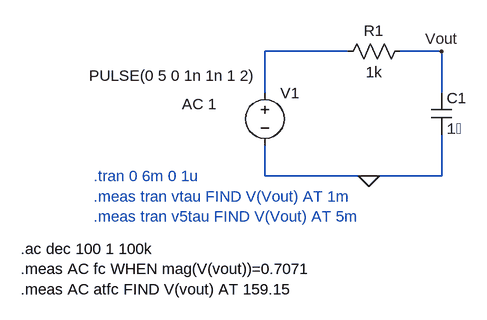
[diagram p0: schematic rc_lowpass.asc]
rc_lowpass.asc, the LTspice schematic file:
Version 4.1
SHEET 1 880 680
WIRE 128 0 0 0
WIRE 272 0 208 0
WIRE 0 64 0 0
WIRE 272 64 272 0
WIRE 0 192 0 144
WIRE 160 192 0 192
WIRE 272 192 272 128
WIRE 272 192 160 192
FLAG 160 192 0
FLAG 272 0 Vout
SYMBOL voltage 0 48 R0
WINDOW 3 -271 -11 Left 2
WINDOW 123 -128 33 Left 2
WINDOW 39 0 0 Left 0
SYMATTR InstName V1
SYMATTR Value PULSE(0 5 0 1n 1n 1 2)
SYMATTR Value2 AC 1
SYMBOL res 224 -16 R90
WINDOW 0 0 56 VBottom 2
WINDOW 3 32 56 VTop 2
SYMATTR InstName R1
SYMATTR Value 1k
SYMBOL cap 256 64 R0
SYMATTR InstName C1
SYMATTR Value 1�
TEXT -264 192 Left 2 ;.tran 0 6m 0 1u\n.meas tran vtau FIND V(Vout) AT 1m\n.meas tran v5tau FIND V(Vout) AT 5m
TEXT -376 304 Left 2 !.ac dec 100 1 100k\n.meas AC fc WHEN mag(V(vout))=0.7071\n.meas AC atfc FIND V(vout) AT 159.15

The netlist it stands for:
* rc_lowpass.asc
V1 N001 0 PULSE(0 5 0 1n 1n 1 2) AC 1
R1 Vout N001 1k
C1 Vout 0 1�
* .tran 0 6m 0 1u
* .meas tran vtau FIND V(Vout) AT 1m
* .meas tran v5tau FIND V(Vout) AT 5m
.ac dec 100 1 100k
.meas AC fc WHEN mag(V(vout))=0.7071
.meas AC atfc FIND V(vout) AT 159.15
.backanno
.end